# Altium project ProbeControl.PrjPcb
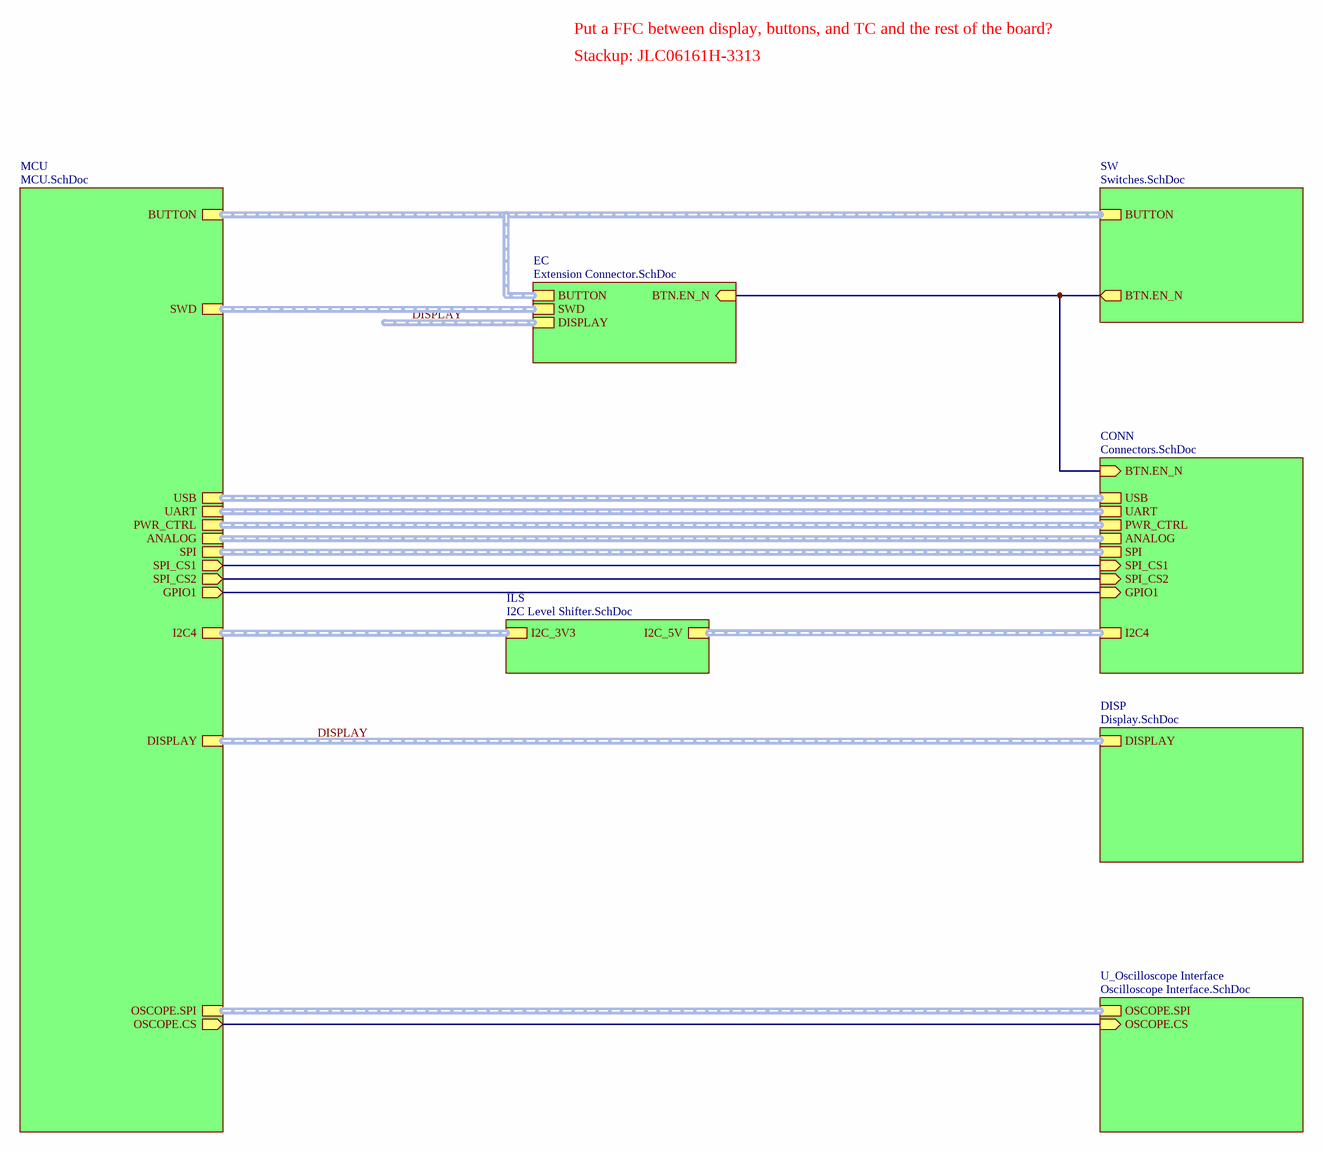
[diagram p0: Top.SchDoc]
8 sheets, 83 parts. Net scope: hierarchical (ports join the sheet entries above them; power ports are global).
Board file: ProbeControl.PcbDoc
Sheets:
  Top.SchDoc
    MCU = MCU.SchDoc
    CONN = Connectors.SchDoc
    DISP = Display.SchDoc
    SW = Switches.SchDoc
    U_Oscilloscope Interface = Oscilloscope Interface.SchDoc
    ILS = I2C Level Shifter.SchDoc
    EC = Extension Connector.SchDoc

## Sheet Top.SchDoc
size 406 x 304 mm; SheetNumber: 1; SheetTotal: 8

### Sub-sheets
CONN = Connectors.SchDoc: USB, UART, PWR_CTRL, ANALOG, SPI, SPI_CS1 (in), SPI_CS2 (in), BTN.EN_N (in), GPIO1 (in), I2C4
DISP = Display.SchDoc: DISPLAY
EC = Extension Connector.SchDoc: BUTTON (harness BTN), BTN.EN_N (in), SWD (harness SWD), DISPLAY
ILS = I2C Level Shifter.SchDoc: I2C_3V3, I2C_5V
MCU = MCU.SchDoc: USB (harness USB), UART (harness UART), PWR_CTRL (harness PWR_CTRL), ANALOG (harness ANALOG), BUTTON (harness BTN), SPI (harness SPI), SPI_CS1 (out), SPI_CS2 (out), DISPLAY (harness I2C), GPIO1 (out), OSCOPE.SPI (harness SPI), OSCOPE.CS (out), I2C4 (harness I2C), SWD (harness SWD)
SW = Switches.SchDoc: BUTTON (harness BTN), BTN.EN_N (out)
U_Oscilloscope Interface = Oscilloscope Interface.SchDoc: OSCOPE.CS (in), OSCOPE.SPI

### Nets
BTN.Enable: sheet CONN/BTN.EN_N, sheet SW/BTN.EN_N, sheet EC/BTN.EN_N
GPIO1: sheet MCU/GPIO1, sheet CONN/GPIO1
SPI1_CS1: sheet MCU/SPI_CS1, sheet CONN/SPI_CS1
SPI1_CS2: sheet MCU/SPI_CS2, sheet CONN/SPI_CS2
SPI2_CS: sheet MCU/OSCOPE.CS, sheet U_Oscilloscope Interface/OSCOPE.CS

### Buses and harness runs
harness DISPLAY = sheet DISP/DISPLAY = sheet MCU/DISPLAY
harness DISPLAY = sheet EC/DISPLAY
harness sheet CONN/ANALOG = sheet MCU/ANALOG
harness sheet CONN/I2C4 = sheet ILS/I2C_5V
harness sheet CONN/PWR_CTRL = sheet MCU/PWR_CTRL
harness sheet CONN/SPI = sheet MCU/SPI
harness sheet CONN/UART = sheet MCU/UART
harness sheet CONN/USB = sheet MCU/USB
harness sheet EC/BUTTON = sheet MCU/BUTTON = sheet SW/BUTTON
harness sheet EC/SWD = sheet MCU/SWD
harness sheet ILS/I2C_3V3 = sheet MCU/I2C4
harness sheet MCU/OSCOPE.SPI = sheet U_Oscilloscope Interface/OSCOPE.SPI

### Notes on the sheet
- Put a FFC between display, buttons, and TC and the rest of the board?
- Stackup: JLC06161H-3313
- Sheet Name:
- Date:
- Sheet
- Designer:
- of

## Sheet MCU.SchDoc
size 406 x 304 mm; SheetNumber: 2; SheetTotal: 8
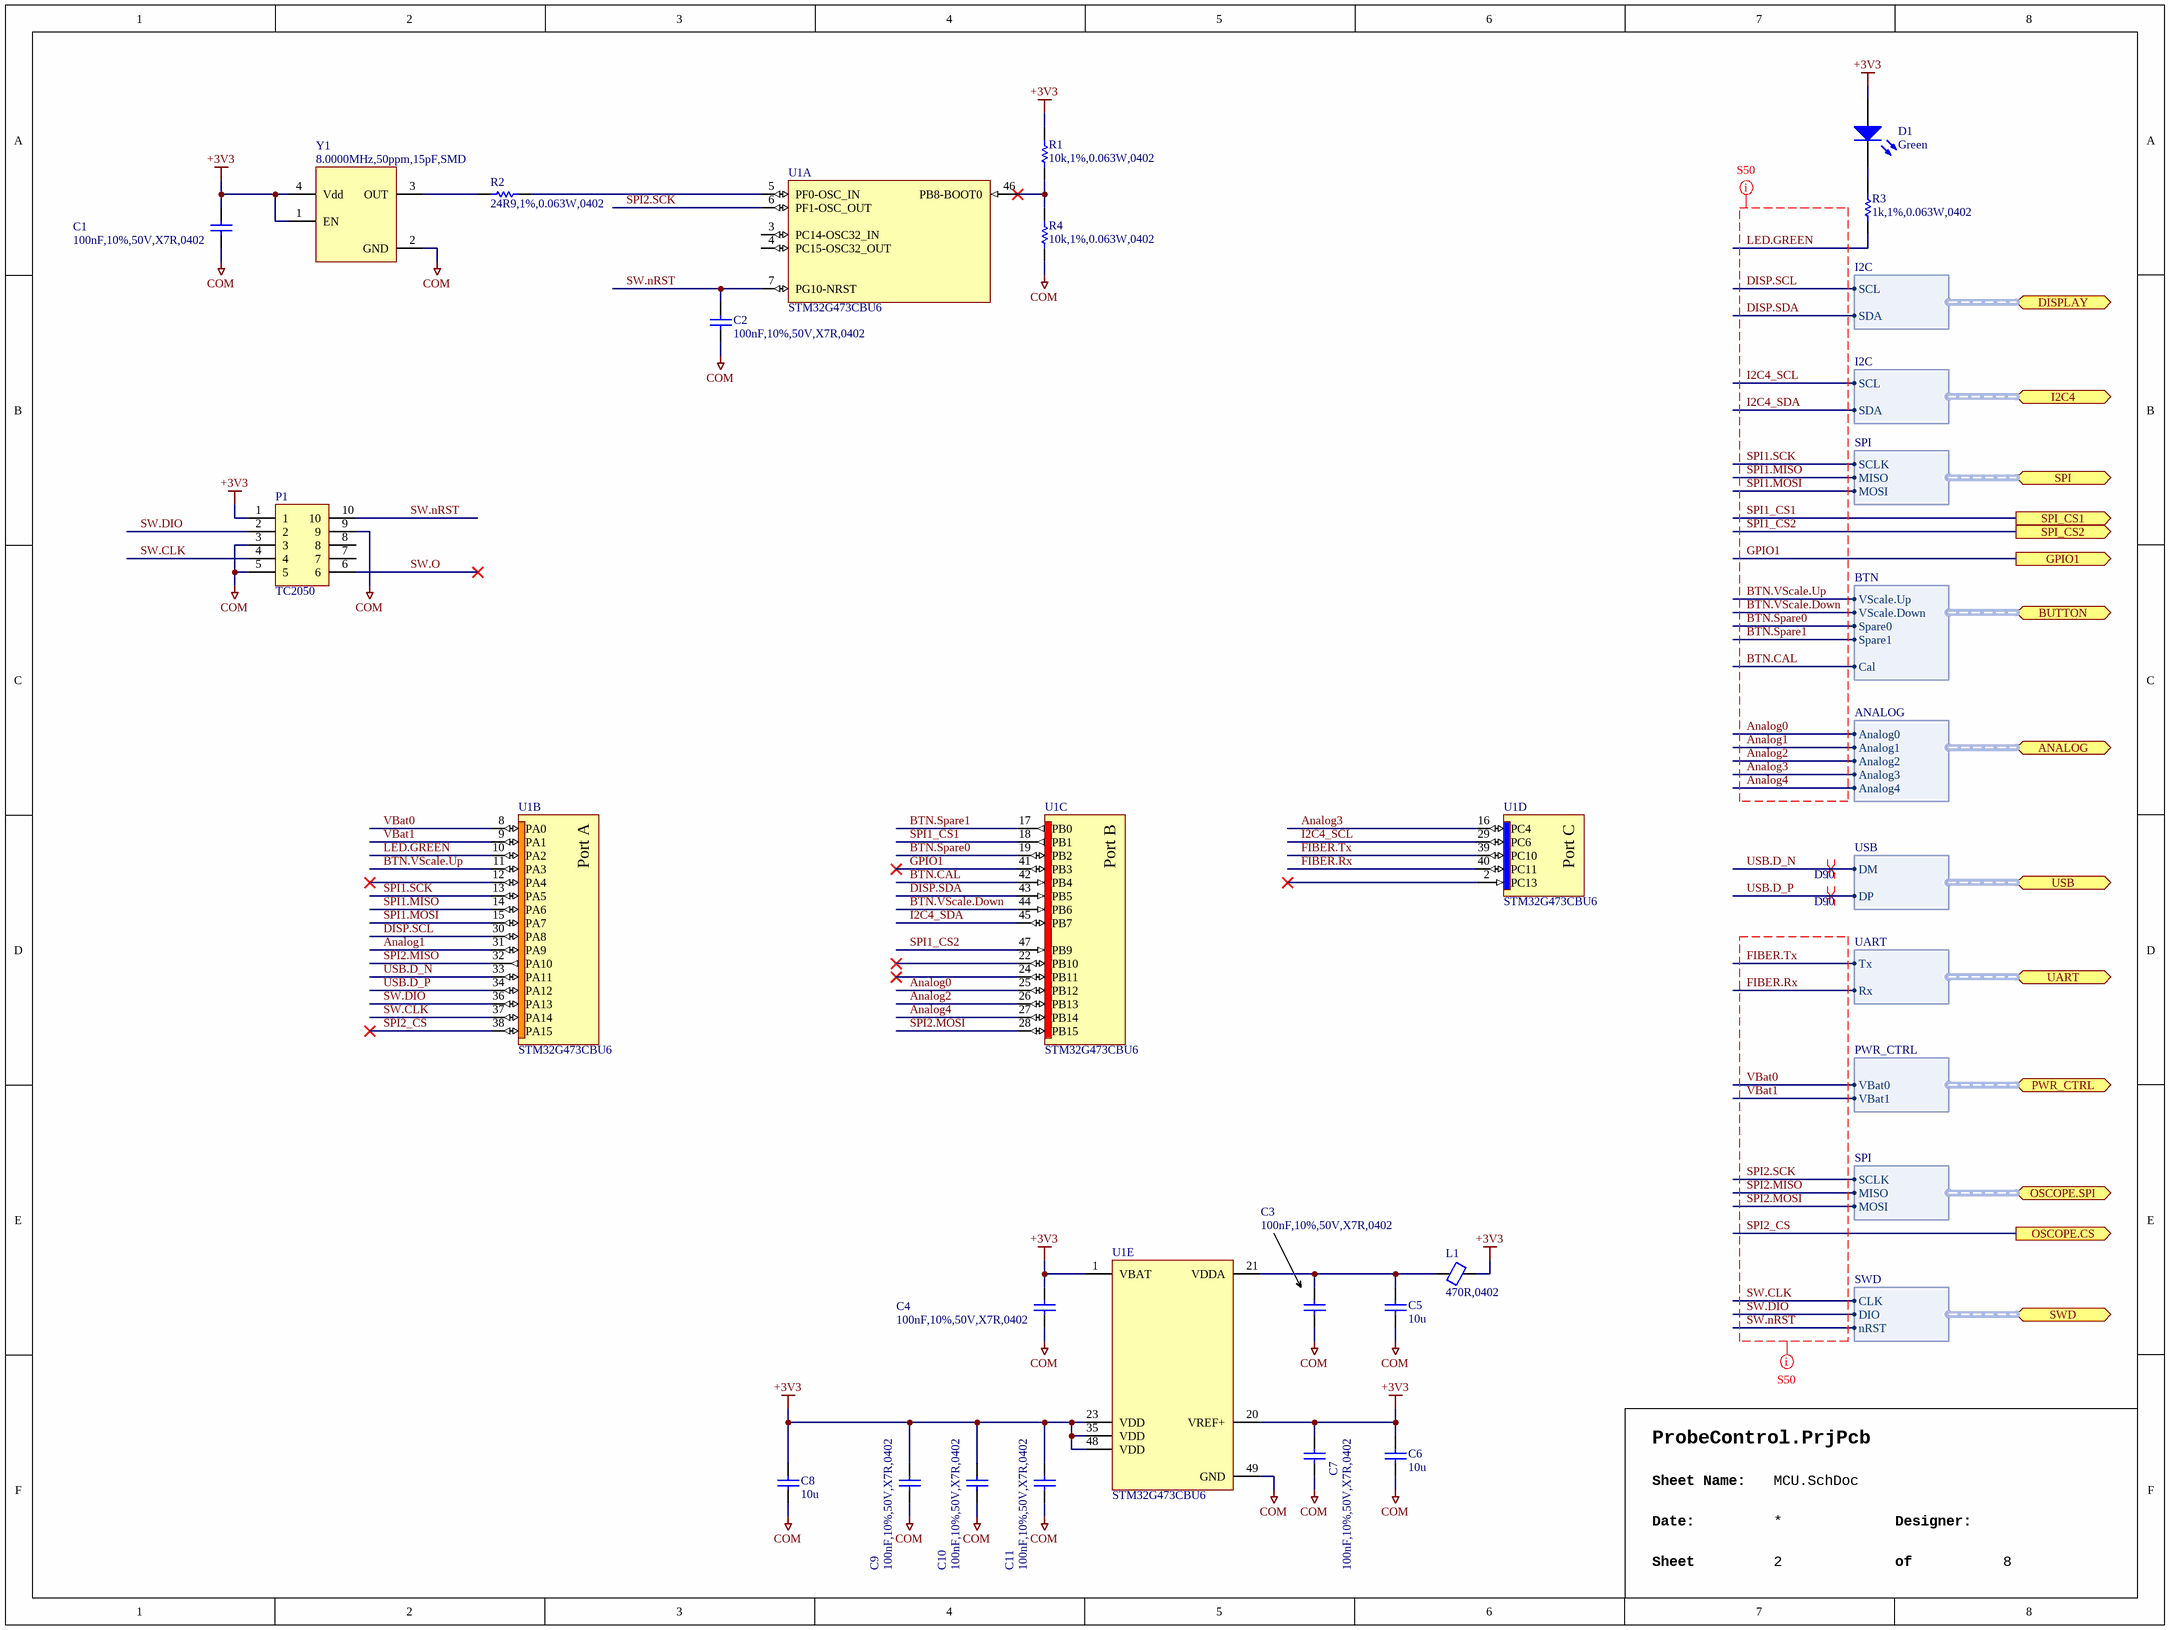
[diagram p1: MCU.SchDoc]

### Parts
C1  100nF,10%,50V,X7R,0402  [CAPC1005X06N]
C2  100nF,10%,50V,X7R,0402  [CAPC1005X06N]
C3  100nF,10%,50V,X7R,0402  [CAPC1005X06N]
C4  100nF,10%,50V,X7R,0402  [CAPC1005X06N]
C5  10u  [CAPC1005X06N]
C6  10u  [CAPC1005X06N]
C7  100nF,10%,50V,X7R,0402  [CAPC1005X06N]
C8  10u  [CAPC1005X06N]
C9  100nF,10%,50V,X7R,0402  [CAPC1005X06N]
C10  100nF,10%,50V,X7R,0402  [CAPC1005X06N]
C11  100nF,10%,50V,X7R,0402  [CAPC1005X06N]
D1  Green  [LITE-ON_LTST-C190KGKT]
L1  470R,0402  [INDC1005X05N]
P1  TC2050  [TAGCONNECT_TC2050-FP]  (no BOM)
R1  10k,1%,0.063W,0402  [RESC1005X04N]
R2  24R9,1%,0.063W,0402  [RESC1005X04N]
R3  1k,1%,0.063W,0402  [RESC1005X04N]
R4  10k,1%,0.063W,0402  [RESC1005X04N]
U1  STM32G473CBU6  [ST_PKG_UFQFN48_A0B9]  (parts A,B,C,D,E of 5)
Y1  8.0000MHz,50ppm,15pF,SMD  [ECS_PKG_3225MV]

### Ports
ANALOG (bidir, harness ANALOG), BUTTON (bidir, harness BTN), DISPLAY (bidir, harness I2C), GPIO1 (out), I2C4 (bidir, harness I2C), OSCOPE.CS (out), OSCOPE.SPI (bidir, harness SPI), PWR_CTRL (bidir, harness PWR_CTRL), SPI (bidir, harness SPI), SPI_CS1 (out), SPI_CS2 (out), SWD (bidir, harness SWD), UART (bidir, harness UART), USB (bidir, harness USB)

### Harnesses
I2C: SCL, SDA
SPI: SCLK, MISO, MOSI
ANALOG: Analog0, Analog1, Analog2, Analog3, Analog4
USB: DM, DP
UART: Tx, Rx
PWR_CTRL: VBat0, VBat1
BTN: VScale.Up, VScale.Down, Spare1, Cal, Spare0
SWD: CLK, DIO, nRST

### Nets
+3V3: C1.1 C4.1 C6.2 C7.1 C8.2 C9.1 C10.1 C11.1 D1.A L1.2 P1.1 R1.2 U1.1(VBAT) U1.20(VREF+) U1.23(VDD) U1.35(VDD) U1.48(VDD) Y1.1(EN) Y1.4(Vdd)
COM: C1.2 C2.1 C3.2 C4.2 C5.1 C6.1 C7.2 C8.1 C9.2 C10.2 C11.2 P1.3 P1.5 P1.9 R4.1 U1.49(GND) Y1.2(GND)
Analog0: U1.25(PB12) ; port ANALOG.Analog0
Analog1: U1.31(PA9) ; port ANALOG.Analog1
Analog2: U1.26(PB13) ; port ANALOG.Analog2
Analog3: U1.16(PC4) ; port ANALOG.Analog3
Analog4: U1.27(PB14) ; port ANALOG.Analog4
BTN.CAL: U1.42(PB4) ; port BUTTON.Cal
BTN.Spare0: U1.19(PB2) ; port BUTTON.Spare0
BTN.Spare1: U1.17(PB0) ; port BUTTON.Spare1
BTN.VScale.Down: U1.44(PB6) ; port BUTTON.VScale.Down
BTN.VScale.Up: U1.11(PA3) ; port BUTTON.VScale.Up
DISP.SCL: U1.30(PA8) ; port DISPLAY.SCL
DISP.SDA: U1.43(PB5) ; port DISPLAY.SDA
FIBER.Rx: U1.40(PC11) ; port UART.Rx
FIBER.Tx: U1.39(PC10) ; port UART.Tx
GPIO1: U1.41(PB3) ; port GPIO1
I2C4_SCL: U1.29(PC6) ; port I2C4.SCL  [project net I2C.SCL.3V3]
I2C4_SDA: U1.45(PB7) ; port I2C4.SDA  [project net I2C.SDA.3V3]
LED.GREEN: R3.1 U1.10(PA2)
SPI1.MISO: U1.14(PA6) ; port SPI.MISO
SPI1.MOSI: U1.15(PA7) ; port SPI.MOSI
SPI1.SCK: U1.13(PA5) ; port SPI.SCLK
SPI1_CS1: U1.18(PB1) ; port SPI_CS1
SPI1_CS2: U1.47(PB9) ; port SPI_CS2
SPI2.MISO: U1.32(PA10) ; port OSCOPE.SPI.MISO
SPI2.MOSI: U1.28(PB15) ; port OSCOPE.SPI.MOSI
SPI2.SCK: U1.6(PF1-OSC_OUT) ; port OSCOPE.SPI.SCLK
SPI2_CS: U1.38(PA15) ; port OSCOPE.CS
SW.CLK: P1.4 U1.37(PA14) ; port SWD.CLK
SW.DIO: P1.2 U1.36(PA13) ; port SWD.DIO
SW.nRST: C2.2 P1.10 U1.7(PG10-NRST) ; port SWD.nRST
SW.O: P1.6
USB.D_N: U1.33(PA11) ; port USB.DM
USB.D_P: U1.34(PA12) ; port USB.DP
VBat0: U1.8(PA0) ; port PWR_CTRL.VBat0
VBat1: U1.9(PA1) ; port PWR_CTRL.VBat1
NetC3_1: C3.1 C5.2 L1.1 U1.21(VDDA)
NetD1_C: D1.C R3.2
NetR1_1: R1.1 R4.2 U1.46(PB8-BOOT0)
NetR2_1: R2.1 Y1.3(OUT)
NetR2_2: R2.2 U1.5(PF0-OSC_IN)

Not connected (* = marked no-connect by the designer): P1 7 8; U1 2(PC13)* 3(PC14-OSC32_IN) 4(PC15-OSC32_OUT) 12(PA4)* 22(PB10)* 24(PB11)*

### Layout directives
net class S50: Analog0, Analog1, Analog2, Analog3, Analog4, BTN.CAL, BTN.Spare0, BTN.Spare1, BTN.VScale.Down, BTN.VScale.Up, DISP.SCL, DISP.SDA, FIBER.Rx, FIBER.Tx, GPIO1, I2C4_SCL, I2C4_SDA, LED.GREEN, SPI1.MISO, SPI1.MOSI, SPI1.SCK, SPI1_CS1, SPI1_CS2, SPI2.MISO, SPI2.MOSI, SPI2.SCK, SPI2_CS, SW.CLK, SW.DIO, SW.nRST, VBat0, VBat1
differential pair; differential pair class D90: USB.D_N, USB.D_P

### Notes on the sheet
- Sheet Name:
- Date:
- Sheet
- Designer:
- of
- (in symbol IC,MCU,QFN48,STM32G473CBU6, part B) Port A
- (in symbol IC,MCU,QFN48,STM32G473CBU6, part C) Port B
- (in symbol IC,MCU,QFN48,STM32G473CBU6, part D) Port C

### Library data of the parts
C1-C4 C7 C9-C11 = CAP,Cer,100nF,10%,50V,X7R,0402: 50V 100nF X7R Â±10% 0402 Ceramic Capacitors ROHS; Manufacturer 1: Murata; Manufacturer 1 Part Number: GRM155R71H104KE14D; Vendor 1 Part Number: C77020; Vendor 1: LCSC; Value: 100n; Part Name: CAP,Cer,100nF,10%,50V,X7R,0402; CreatedBy: Judd Foster; HelpURL: https://www.lcsc.com/datasheet/C77020.pdf
C5 C6 C8 = CAP,Cer,10uF,10VDC,X5R,0402: 10 ï¿½F ï¿½20% 10V Ceramic Capacitor X5R 0402 (1005 Metric); Manufacturer 1: Samsung Electro-Mechanics; Manufacturer 1 Part Number: CL05A106MP5NUNC; Vendor 1 Part Number: 1276-1450-1-ND; Vendor 1: Digikey; Part Name: CAP,Cer,10uF,10VDC,X5R,0402; CreatedBy: Judd Foster; HelpURL: https://media.digikey.com/pdf/Data%20Sheets/Samsung%20PDFs/CL05A106MP5NUNC_Spec.pdf; Value: 10u
D1 = LED,Green,SMD,0603: Green 571nm LED Indication - Discrete 2V 0603 (1608 Metric); Manufacturer 1: Lite-On Inc.; Manufacturer 1 Part Number: LTST-C190KGKT; Vendor 1 Part Number: 160-1435-1-ND; Vendor 1: Digikey; Part Name: LED,Green,SMD,0603; CreatedBy: Judd Foster; HelpURL: https://optoelectronics.liteon.com/upload/download/DS22-2000-074/LTST-C190KGKT.PDF; Value: Green
L1 = Ferrite,470R@100MHz,0402: 470 Ohms @ 100 MHz 1 Power Line Ferrite Bead 0402 (1005 Metric) 1A 200mOhm; Manufacturer 1: Murata Electronics; Manufacturer 1 Part Number: BLM15PX471SN1D; Vendor 1 Part Number: 490-10662-1-ND; Vendor 1: Digikey; Value: 470; Part Name: Ferrite,470R@100MHz,0402; CreatedBy: Judd Foster; HelpURL: https://www.murata.com/en-us/products/productdata/8796740059166/ENFA0018.pdf
P1 = CONN,Tag-Connect,TC2050-IDC: PLUG-OF-NAILS 10-PIN W/ LEGS 8"; Manufacturer 1: Tag-Connect LLC; Part Name: CONN,Tag-Connect,TC2050-IDC; CreatedBy: Kevin Heyer; HelpURL: https://www.tag-connect.com/wp-content/uploads/bsk-pdf-manager/TC2050-IDC_Datasheet_7.pdf; Manufacturer 1 Part Number: N/A
R1 R4 = RES,10k,1%,0.063W,0402: RES 10K OHM 1% 1/16W 0402; Manufacturer 1: Vishay Dale; Manufacturer 1 Part Number: CRCW040210K0FKED; Part Name: RES,10k,1%,0.063W,0402; CreatedBy: Kevin Heyer; HelpURL: https://www.vishay.com/docs/20035/dcrcwe3.pdf; Value: 10k
R2 = RES,24R9,1%,0.063W,0402: RES 24.9 OHM 1% 1/16W 0402; Manufacturer 1: Vishay Dale; Manufacturer 1 Part Number: CRCW040224R9FKED; Value: 24.9; Part Name: RES,24R9,1%,0.063W,0402; CreatedBy: Kevin Heyer; HelpURL: https://www.vishay.com/docs/20035/dcrcwe3.pdf
R3 = RES,1k,1%,0.063W,0402: RES 1K OHM 1% 1/16W 0402; Manufacturer 1: Vishay Dale; Manufacturer 1 Part Number: CRCW04021K00FKED; Part Name: RES,1k,1%,0.063W,0402; CreatedBy: Kevin Heyer; HelpURL: https://www.vishay.com/docs/20035/dcrcwe3.pdf; Value: 1k
U1 = IC,MCU,QFN48,STM32G473CBU6: IC MCU 32BIT 128KB FLSH 48UFQFPN; Manufacturer 1: ST Microelectronics; Part Name: IC,MCU,QFN48,STM32G473CBU6; CreatedBy: Kevin Heyer; HelpURL: https://www.st.com/resource/en/datasheet/stm32g473cb.pdf; Manufacturer 1 Part Number: STM32G473CBU6; Value: STM32G473CBU6
Y1 = XTAL,8.0000MHz,OSC,50ppm,15pF,SMD: Manufacturer 1: ECS Inc.; Manufacturer 1 Part Number: ECS-3225MV-080-BN-TR3; Part Name: XTAL,8.0000MHz,OSC,50ppm,15pF,SMD; CreatedBy: Kevin Heyer; HelpURL: https://ecsxtal.com/store/pdf/ECS-3225MV.pdf; Value: 8.0000MHz,50ppm,15pF,SMD

## Sheet Connectors.SchDoc
size 406 x 304 mm; SheetNumber: 4; SheetTotal: 8
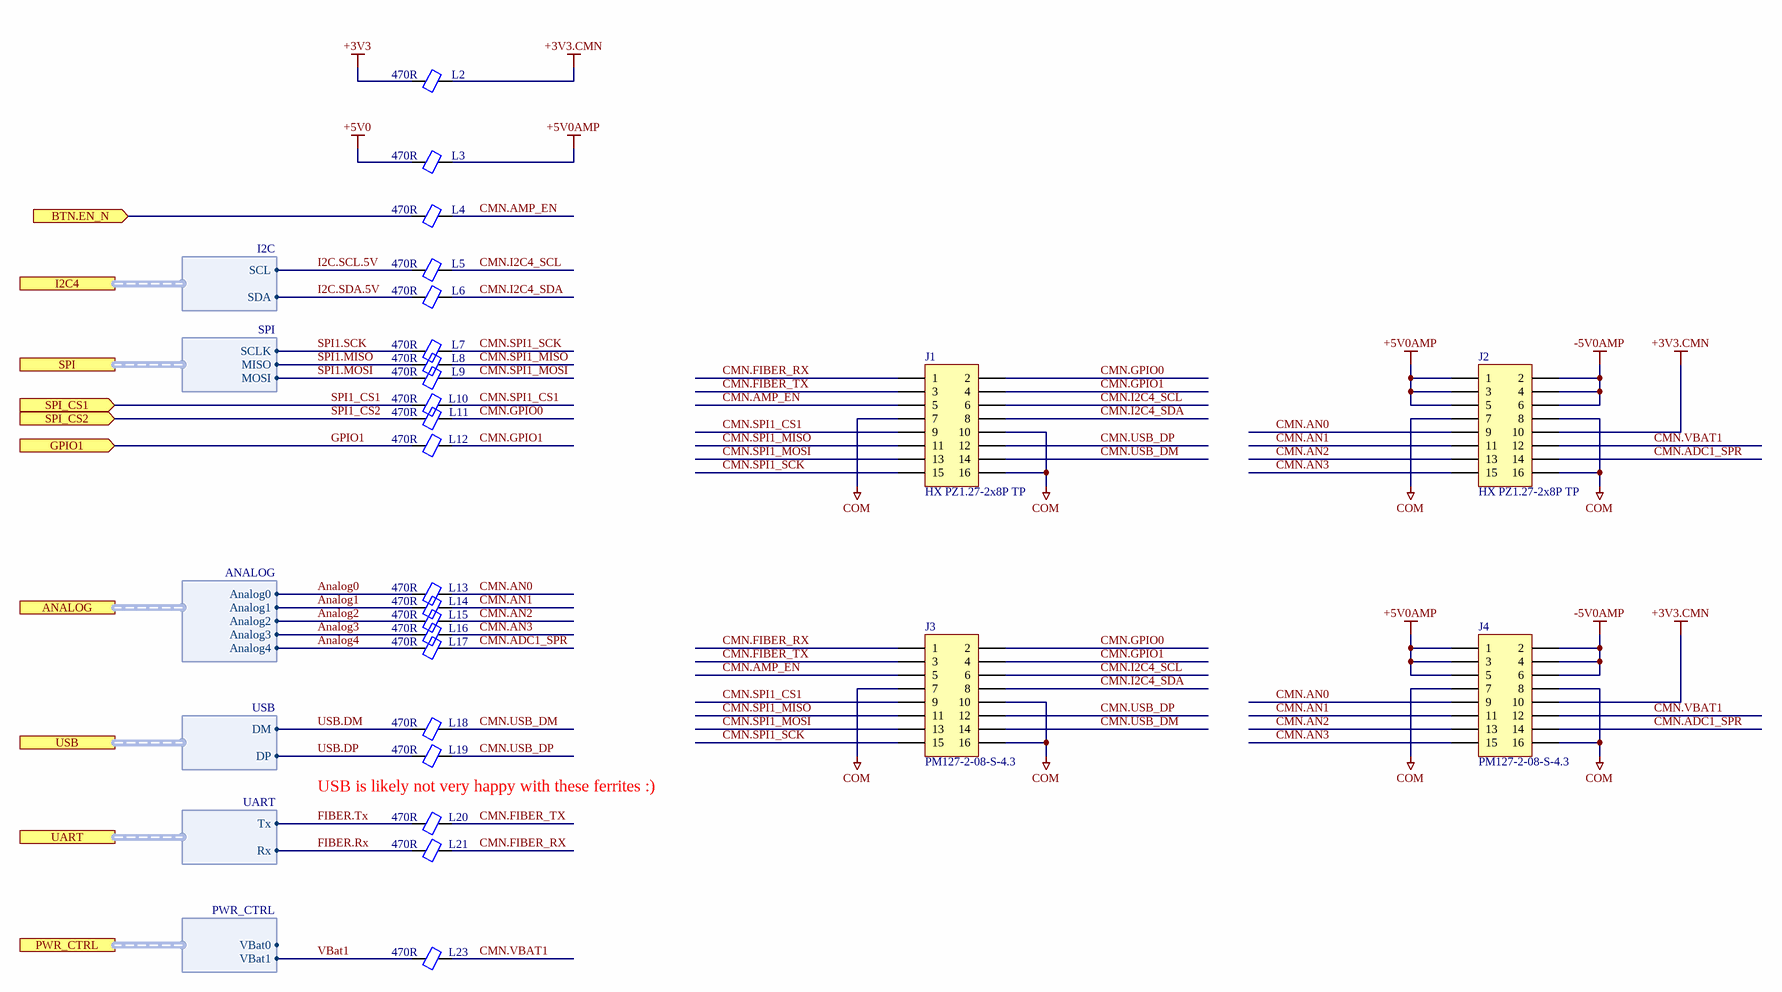
[diagram p2: Connectors.SchDoc]

### Parts
J1  HX PZ1.27-2x8P TP  [HANXIA_HX PZ1.27-2x8P TP]
J2  HX PZ1.27-2x8P TP  [HANXIA_HX PZ1.27-2x8P TP]
J3  PM127-2-08-S-4.3  [HCTL_PM127-2-08-S-4.3]
J4  PM127-2-08-S-4.3  [HCTL_PM127-2-08-S-4.3]
L2  470R  [INDC1005X05N]
L3  470R  [INDC1005X05N]
L4  470R  [INDC1005X05N]
L5  470R  [INDC1005X05N]
L6  470R  [INDC1005X05N]
L7  470R  [INDC1005X05N]
L8  470R  [INDC1005X05N]
L9  470R  [INDC1005X05N]
L10  470R  [INDC1005X05N]
L11  470R  [INDC1005X05N]
L12  470R  [INDC1005X05N]
L13  470R  [INDC1005X05N]
L14  470R  [INDC1005X05N]
L15  470R  [INDC1005X05N]
L16  470R  [INDC1005X05N]
L17  470R  [INDC1005X05N]
L18  470R  [INDC1005X05N]
L19  470R  [INDC1005X05N]
L20  470R  [INDC1005X05N]
L21  470R  [INDC1005X05N]
L23  470R  [INDC1005X05N]

### Ports
ANALOG (harness ANALOG), BTN.EN_N (in), GPIO1 (in), I2C4 (harness I2C), PWR_CTRL (harness PWR_CTRL), SPI (harness SPI), SPI_CS1 (in), SPI_CS2 (in), UART (harness UART), USB (harness USB)

### Harnesses
I2C: SCL, SDA
SPI: SCLK, MISO, MOSI
ANALOG: Analog0, Analog1, Analog2, Analog3, Analog4
USB: DM, DP
UART: Tx, Rx
PWR_CTRL: VBat0, VBat1

### Nets
+3V3: L2.1
+3V3.CMN: J2.10 J4.10 L2.2
+5V0: L3.1
+5V0AMP: J2.1 J2.3 J2.5 J4.1 J4.3 J4.5 L3.2
-5V0AMP: J2.2 J2.4 J2.6 J4.2 J4.4 J4.6
COM: J1.7 J1.10 J1.16 J2.7 J2.8 J2.16 J3.7 J3.10 J3.16 J4.7 J4.8 J4.16
Analog0: L13.1 ; port ANALOG.Analog0
Analog1: L14.1 ; port ANALOG.Analog1
Analog2: L15.1 ; port ANALOG.Analog2
Analog3: L16.1 ; port ANALOG.Analog3
Analog4: L17.1 ; port ANALOG.Analog4
BTN.Enable: L4.1 ; port BTN.EN_N
CMN.ADC1_SPR: J2.14 J4.14 L17.2
CMN.AMP_EN: J1.5 J3.5 L4.2
CMN.AN0: J2.9 J4.9 L13.2
CMN.AN1: J2.11 J4.11 L14.2
CMN.AN2: J2.13 J4.13 L15.2
CMN.AN3: J2.15 J4.15 L16.2
CMN.FIBER_RX: J1.1 J3.1 L21.2
CMN.FIBER_TX: J1.3 J3.3 L20.2
CMN.GPIO0: J1.2 J3.2 L11.2
CMN.GPIO1: J1.4 J3.4 L12.2
CMN.I2C4_SCL: J1.6 J3.6 L5.2
CMN.I2C4_SDA: J1.8 J3.8 L6.2
CMN.SPI1_CS1: J1.9 J3.9 L10.2
CMN.SPI1_MISO: J1.11 J3.11 L8.2
CMN.SPI1_MOSI: J1.13 J3.13 L9.2
CMN.SPI1_SCK: J1.15 J3.15 L7.2
CMN.USB_DM: J1.14 J3.14 L18.2
CMN.USB_DP: J1.12 J3.12 L19.2
CMN.VBAT1: J2.12 J4.12 L23.2
FIBER.Rx: L21.1 ; port UART.Rx
FIBER.Tx: L20.1 ; port UART.Tx
GPIO1: L12.1 ; port GPIO1
I2C.SCL.5V: L5.1 ; port I2C4.SCL
I2C.SDA.5V: L6.1 ; port I2C4.SDA
SPI1.MISO: L8.1 ; port SPI.MISO
SPI1.MOSI: L9.1 ; port SPI.MOSI
SPI1.SCK: L7.1 ; port SPI.SCLK
SPI1_CS1: L10.1 ; port SPI_CS1
SPI1_CS2: L11.1 ; port SPI_CS2
USB.DM: L18.1 ; port USB.DM  [project net USB.D_N]
USB.DP: L19.1 ; port USB.DP  [project net USB.D_P]
VBat1: L23.1 ; port PWR_CTRL.VBat1

### Notes on the sheet
- USB is likely not very happy with these ferrites :)
- Sheet Name:
- Date:
- Sheet
- Designer:
- of

### Library data of the parts
J1 J2 = CONN,Hdr,2x8 Pin,1.27mm,SMD: CONN HEADER 16POS 1.27mm DUAL ROW SMD; Manufacturer 1: hanxia; Vendor 1 Part Number: C41376040; Vendor 1: LCSC; Part Name: CONN,Hdr,2x8 Pin,1.27mm,SMD; CreatedBy: Judd Foster; HelpURL: https://www.lcsc.com/datasheet/C41376040.pdf?spm=wm.sxq.inf.ggs___wm.fly.bg.0.xh&lcsc_vid=T1ELXwUHQlNYVlZRE1JdXlRQFVgNBF1eTlFXBVxWRAAxVlNeQ1lYVlFUQlNXXjsOAxUeFF5JWBYZEEoKFBINSQcJGk4eFQsCAgIaSgADAwAHC0slRFhZUlVVQ08GEwkK; Manufacturer 1 Part Number: HX PZ1.27-2x8P TP
J3 J4 = CONN,Rcpt,2x8 Pin,1.27mm,SMD: CONN SOCKET 16POS 1.27mm DUAL ROW SMD; Manufacturer 1: HCTL; Vendor 1 Part Number: C3975134; Vendor 1: LCSC; Part Name: CONN,Rcpt,2x8 Pin,1.27mm,SMD; CreatedBy: Judd Foster; HelpURL: https://www.lcsc.com/datasheet/C3975134.pdf?spm=wm.sxq.inf.ggs___wm.fly.bg.0.xh&lcsc_vid=T1ELXwUHQlNYVlZRE1JdXlRQFVgNBF1eTlFXBVxWRAAxVlNeQ1lYVldfR1VbXjsOAxUeFF5JWBYZEEoKFBINSQcJGk4dAgUUFAk%3D; Manufacturer 1 Part Number: PM127-2-08-S-4.3
L2-L21 L23 = Ferrite,470R@100MHz,0402: 470 Ohms @ 100 MHz 1 Power Line Ferrite Bead 0402 (1005 Metric) 1A 200mOhm; Manufacturer 1: Murata Electronics; Manufacturer 1 Part Number: BLM15PX471SN1D; Vendor 1 Part Number: 490-10662-1-ND; Vendor 1: Digikey; Part Name: Ferrite,470R@100MHz,0402; CreatedBy: Judd Foster; HelpURL: https://www.murata.com/en-us/products/productdata/8796740059166/ENFA0018.pdf; Value: 470R

## Sheet Display.SchDoc
size 406 x 304 mm; SheetNumber: 5; SheetTotal: 8
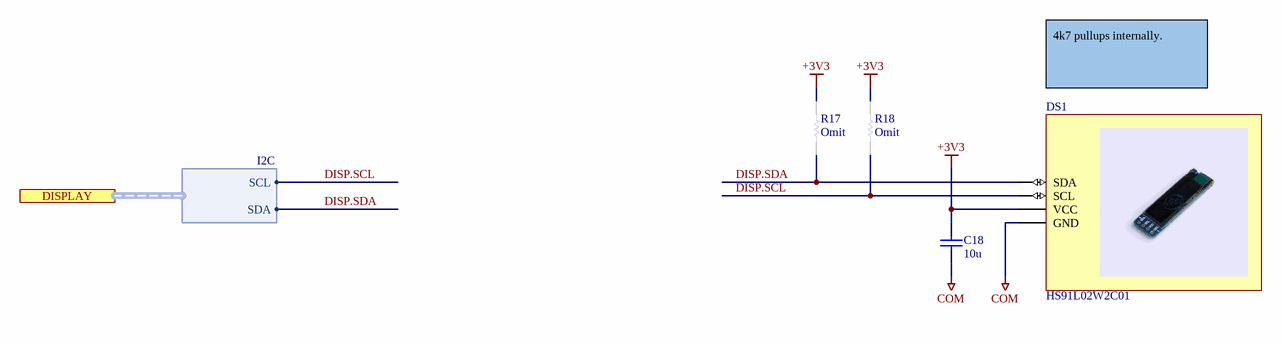
[diagram p3: Display.SchDoc]

### Parts
C18  10u  [CAPC1005X06N]
DS1  HS91L02W2C01  [HS_HS91L02W2C01]
R17  Omit  [RESC1005X04N]  (no BOM)
R18  Omit  [RESC1005X04N]  (no BOM)

### Ports
DISPLAY (harness I2C)

### Harnesses
I2C: SCL, SDA

### Nets
+3V3: C18.2 DS1.2(VCC) R17.2 R18.2
COM: C18.1 DS1.1(GND)
DISP.SCL: DS1.3(SCL) R18.1 ; port DISPLAY.SCL
DISP.SDA: DS1.4(SDA) R17.1 ; port DISPLAY.SDA

### Notes on the sheet
- 4k7 pullups internally.
- Sheet Name:
- Date:
- Sheet
- Designer:
- of

### Library data of the parts
C18 = CAP,Cer,10uF,10VDC,X5R,0402: as C5 on sheet MCU; Part Name: CAP,Cer,10uF,10VDC,X5R,0402; CreatedBy: Judd Foster; HelpURL: https://media.digikey.com/pdf/Data%20Sheets/Samsung%20PDFs/CL05A106MP5NUNC_Spec.pdf; Value: 10u
DS1 = DISP,Graphic,OLED,128x32,HS91L02W2C01: 0.91 128x32 SSD1306 chip I2C LCD, OLED, Graphic; Manufacturer 1: HS; Vendor 1 Part Number: C5248081; Vendor 1: LCSC; Part Name: DISP,Graphic,OLED,128x32,HS91L02W2C01; CreatedBy: Judd Foster; HelpURL: https://www.lcsc.com/datasheet/C5248081.pdf; Manufacturer 1 Part Number: HS91L02W2C01
R17 R18 = RES,Omit,0402: Part Name: RES,Omit,0402; CreatedBy: Judd Foster; HelpURL: N/A; Manufacturer 1: N/A; Manufacturer 1 Part Number: N/A; Vendor 1: N/A; Vendor 1 Part Number: N/A; Value: Omit

## Sheet Switches.SchDoc
size 406 x 304 mm; SheetNumber: 3; SheetTotal: 8
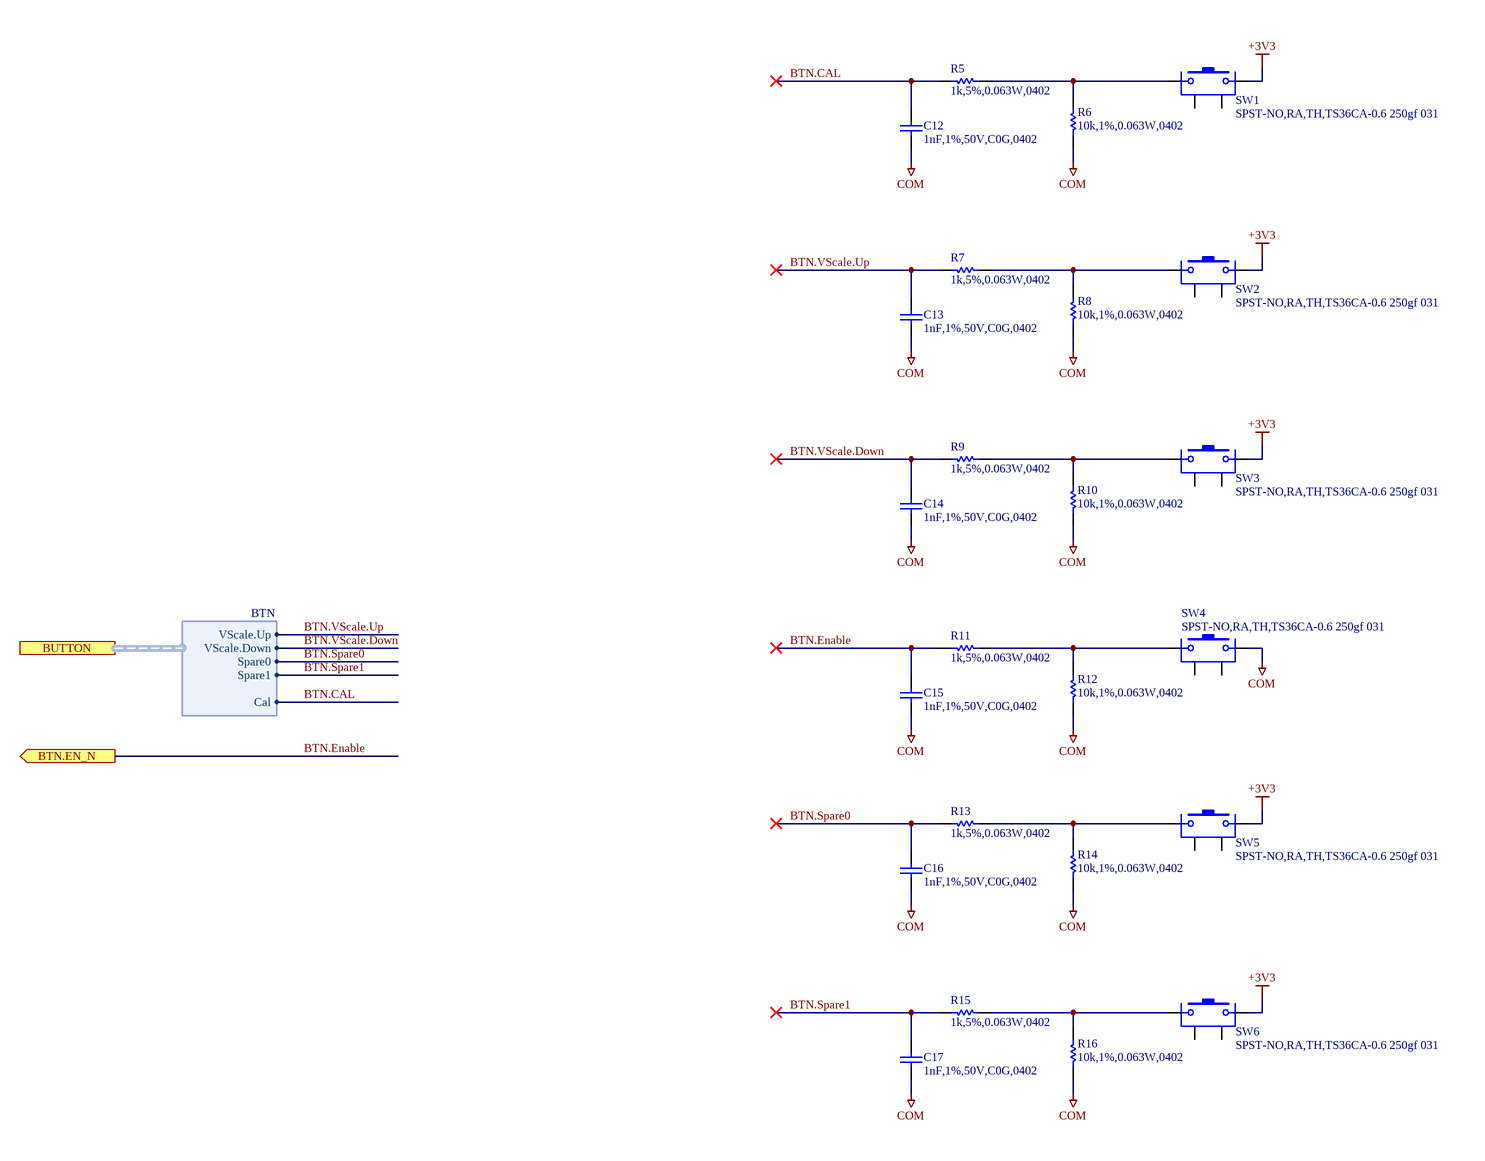
[diagram p4: Switches.SchDoc]

### Parts
C12  1nF,1%,50V,C0G,0402  [CAPC1005X06N]
C13  1nF,1%,50V,C0G,0402  [CAPC1005X06N]
C14  1nF,1%,50V,C0G,0402  [CAPC1005X06N]
C15  1nF,1%,50V,C0G,0402  [CAPC1005X06N]
C16  1nF,1%,50V,C0G,0402  [CAPC1005X06N]
C17  1nF,1%,50V,C0G,0402  [CAPC1005X06N]
R5  1k,5%,0.063W,0402  [RESC1005X04N]
R6  10k,1%,0.063W,0402  [RESC1005X04N]
R7  1k,5%,0.063W,0402  [RESC1005X04N]
R8  10k,1%,0.063W,0402  [RESC1005X04N]
R9  1k,5%,0.063W,0402  [RESC1005X04N]
R10  10k,1%,0.063W,0402  [RESC1005X04N]
R11  1k,5%,0.063W,0402  [RESC1005X04N]
R12  10k,1%,0.063W,0402  [RESC1005X04N]
R13  1k,5%,0.063W,0402  [RESC1005X04N]
R14  10k,1%,0.063W,0402  [RESC1005X04N]
R15  1k,5%,0.063W,0402  [RESC1005X04N]
R16  10k,1%,0.063W,0402  [RESC1005X04N]
SW1  SPST-NO,RA,TH,TS36CA-0.6 250gf 031  [SHOU_HAN_TS36CA-0.6 250gf 031]
SW2  SPST-NO,RA,TH,TS36CA-0.6 250gf 031  [SHOU_HAN_TS36CA-0.6 250gf 031]
SW3  SPST-NO,RA,TH,TS36CA-0.6 250gf 031  [SHOU_HAN_TS36CA-0.6 250gf 031]
SW4  SPST-NO,RA,TH,TS36CA-0.6 250gf 031  [SHOU_HAN_TS36CA-0.6 250gf 031]
SW5  SPST-NO,RA,TH,TS36CA-0.6 250gf 031  [SHOU_HAN_TS36CA-0.6 250gf 031]
SW6  SPST-NO,RA,TH,TS36CA-0.6 250gf 031  [SHOU_HAN_TS36CA-0.6 250gf 031]

### Ports
BTN.EN_N (out), BUTTON (harness BTN)

### Harnesses
BTN: VScale.Up, VScale.Down, Spare1, Cal, Spare0

### Nets
+3V3: SW1.1 SW2.1 SW3.1 SW5.1 SW6.1
COM: C12.1 C13.1 C14.1 C15.1 C16.1 C17.1 R6.1 R8.1 R10.1 R12.1 R14.1 R16.1 SW4.1
BTN.CAL: C12.2 R5.2 ; port BUTTON.Cal
BTN.Enable: C15.2 R11.2 ; port BTN.EN_N
BTN.Spare0: C16.2 R13.2 ; port BUTTON.Spare0
BTN.Spare1: C17.2 R15.2 ; port BUTTON.Spare1
BTN.VScale.Down: C14.2 R9.2 ; port BUTTON.VScale.Down
BTN.VScale.Up: C13.2 R7.2 ; port BUTTON.VScale.Up
NetR5_1: R5.1 R6.2 SW1.2
NetR7_1: R7.1 R8.2 SW2.2
NetR9_1: R9.1 R10.2 SW3.2
NetR11_1: R11.1 R12.2 SW4.2
NetR13_1: R13.1 R14.2 SW5.2
NetR15_1: R15.1 R16.2 SW6.2

Not connected (* = marked no-connect by the designer): SW1 0; SW2 0; SW3 0; SW4 0; SW5 0; SW6 0

### Notes on the sheet
- Sheet Name:
- Date:
- Sheet
- Designer:
- of

### Library data of the parts
C12-C17 = CAP,CER,1nF,1%,50V,C0G,0402: Manufacturer 1: Murata; Manufacturer 1 Part Number: GCM1555C1H102FA16D; Value: 1n; Part Name: CAP,CER,1nF,1%,50V,C0G,0402; CreatedBy: Kevin Heyer; HelpURL: https://pim.murata.com/asset/pim4/ceramicCapacitorSMD/GCM1555C1H102FA16-01A-EN_PDF_CERAMICCAPACITORSMD
R5 R7 R9 R11 R13 R15 = RES,1k,5%,0.063W,0402: 1 kOhms ï¿½5% 0.063W, 1/16W Chip Resistor 0402 (1005 Metric) Automotive AEC-Q200 Thick Film; Manufacturer 1: Stackpole Electronics Inc; Manufacturer 1 Part Number: RMCF0402JT1K00; Vendor 1 Part Number: RMCF0402JT1K00CT-ND; Vendor 1: DIgikey; Part Name: RES,1k,5%,0.063W,0402; CreatedBy: Judd Foster; HelpURL: https://www.seielect.com/catalog/sei-rmcf_rmcp.pdf; Value: 1k
R6 R8 R10 R12 R14 R16 = RES,10k,1%,0.063W,0402: as R1 on sheet MCU; Part Name: RES,10k,1%,0.063W,0402; CreatedBy: Kevin Heyer; HelpURL: https://www.vishay.com/docs/20035/dcrcwe3.pdf; Value: 10k
SW1-SW6 = Switch,Tactile,SPST-NO,RA,TH,TS36CA-0.6 250gf 031: Manufacturer 1: SHOU HAN; Vendor 1 Part Number: C2906288; Vendor 1: LCSC; Part Name: Switch,Tactile,SPST-NO,RA,TH,TS36CA-0.6 250gf 031; CreatedBy: Kevin Heyer; HelpURL: https://www.lcsc.com/datasheet/C2906288.pdf; Manufacturer 1 Part Number: TS36CA-0.6 250gf 031; Value: TS36CA-0.6 250gf 031

## Sheet Oscilloscope Interface.SchDoc
size 406 x 304 mm; SheetNumber: 8; SheetTotal: 9
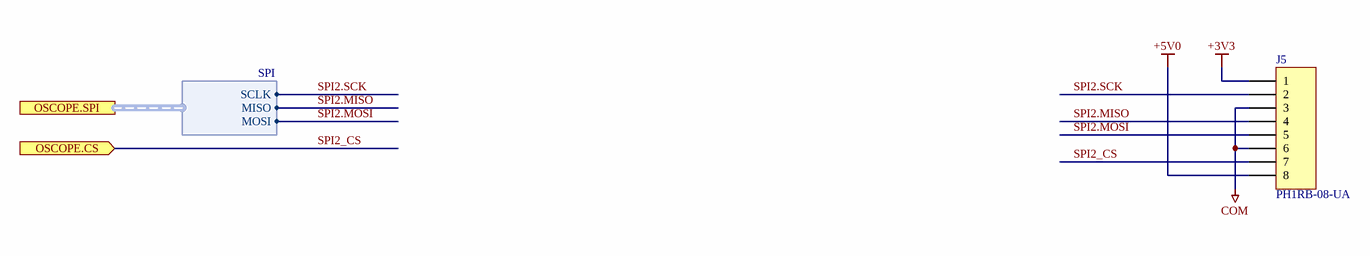
[diagram p5: Oscilloscope Interface.SchDoc]

### Parts
J5  PH1RB-08-UA  [ADAMTECH_PH1RB-08-UA]

### Ports
OSCOPE.CS (in), OSCOPE.SPI (harness SPI)

### Harnesses
SPI: SCLK, MISO, MOSI

### Nets
+3V3: J5.1
+5V0: J5.8
COM: J5.3 J5.6
SPI2.MISO: J5.4 ; port OSCOPE.SPI.MISO
SPI2.MOSI: J5.5 ; port OSCOPE.SPI.MOSI
SPI2.SCK: J5.2 ; port OSCOPE.SPI.SCLK
SPI2_CS: J5.7 ; port OSCOPE.CS

### Notes on the sheet
- Sheet Name:
- Date:
- Sheet
- Designer:
- of

### Library data of the parts
J5 = Term,Header,1x8 Pin,2.54mm,Right,Thru: Connector Header Through Hole, Right Angle 8 position 0.100" (2.54mm); Manufacturer 1: Adam Tech; Vendor 1 Part Number: 2057-PH1RB-08-UA-ND; Vendor 1: Digikey; Part Name: Term,Header,1x8 Pin,2.54mm,Right,Thru; CreatedBy: Judd Foster; HelpURL: https://app.adam-tech.com/products/download/data_sheet/201281/ph1rb-xx-ua-data-sheet.pdf; Manufacturer 1 Part Number: PH1RB-08-UA

## Sheet I2C Level Shifter.SchDoc
size 406 x 304 mm; SheetNumber: 6; SheetTotal: 8
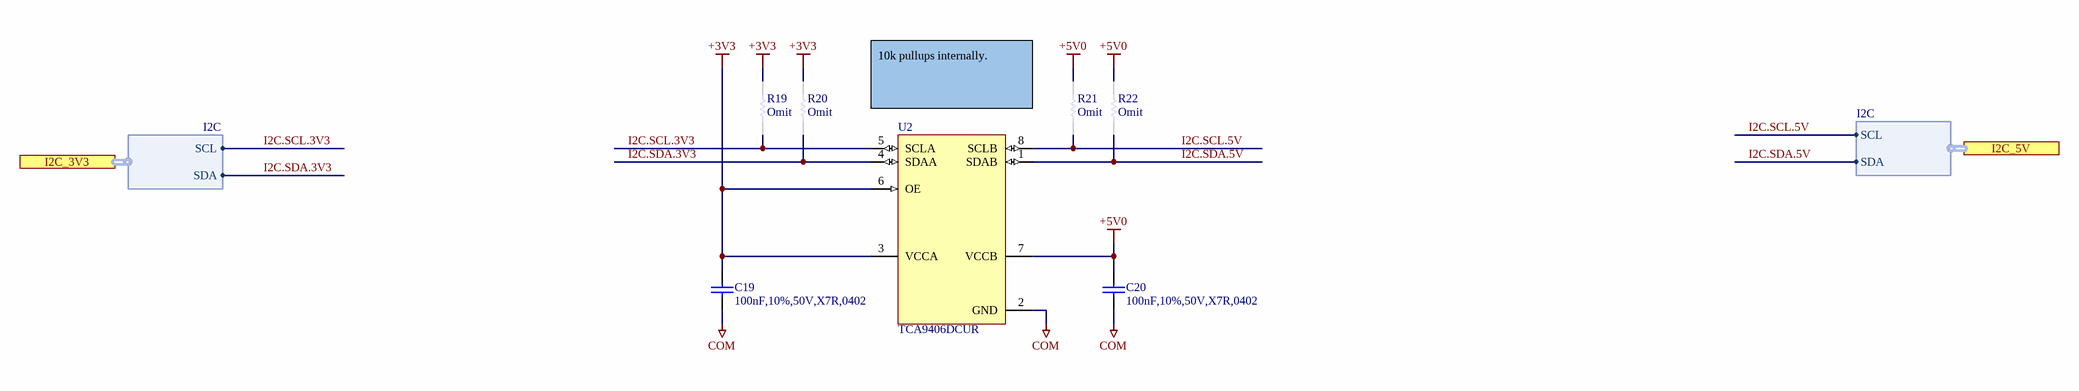
[diagram p6: I2C Level Shifter.SchDoc]

### Parts
C19  100nF,10%,50V,X7R,0402  [CAPC1005X06N]
C20  100nF,10%,50V,X7R,0402  [CAPC1005X06N]
R19  Omit  [RESC1005X04N]  (no BOM)
R20  Omit  [RESC1005X04N]  (no BOM)
R21  Omit  [RESC1005X04N]  (no BOM)
R22  Omit  [RESC1005X04N]  (no BOM)
U2  TCA9406DCUR  [TEXASINSTRUMENTS_PKG_DCU0008A]

### Ports
I2C_3V3 (harness I2C), I2C_5V (harness I2C)

### Harnesses
I2C: SCL, SDA

### Nets
+3V3: C19.2 R19.2 R20.2 U2.3(VCCA) U2.6(OE)
+5V0: C20.2 R21.2 R22.2 U2.7(VCCB)
COM: C19.1 C20.1 U2.2(GND)
I2C.SCL.3V3: R19.1 U2.5(SCLA) ; port I2C_3V3.SCL
I2C.SCL.5V: R21.1 U2.8(SCLB) ; port I2C_5V.SCL
I2C.SDA.3V3: R20.1 U2.4(SDAA) ; port I2C_3V3.SDA
I2C.SDA.5V: R22.1 U2.1(SDAB) ; port I2C_5V.SDA

### Notes on the sheet
- 10k pullups internally.
- Sheet Name:
- Date:
- Sheet
- Designer:
- of

### Library data of the parts
C19 C20 = CAP,Cer,100nF,10%,50V,X7R,0402: as C1 on sheet MCU; Part Name: CAP,Cer,100nF,10%,50V,X7R,0402; CreatedBy: Judd Foster; HelpURL: https://www.lcsc.com/datasheet/C77020.pdf
R19-R22 = RES,Omit,0402: Part Name: RES,Omit,0402; CreatedBy: Judd Foster; HelpURL: N/A; Manufacturer 1: N/A; Manufacturer 1 Part Number: N/A; Vendor 1: N/A; Vendor 1 Part Number: N/A; Value: Omit
U2 = TCA9406DCUR: Voltage Level Translator Bidirectional 1 Circuit 2 Channel 24Mbps 8-VSSOP; Manufacturer 1: Texas Instruments; Vendor 1 Part Number: 296-28109-1-ND; Vendor 1: DigiKey; Part Name: TCA9406DCUR; CreatedBy: Judd Foster; HelpURL: https://www.ti.com/general/docs/suppproductinfo.tsp?distId=10&gotoUrl=https%3A%2F%2Fwww.ti.com%2Flit%2Fgpn%2Ftca9406; Manufacturer 1 Part Number: TCA9406DCUR

## Sheet Extension Connector.SchDoc
size 406 x 304 mm; SheetNumber: 9; SheetTotal: 9
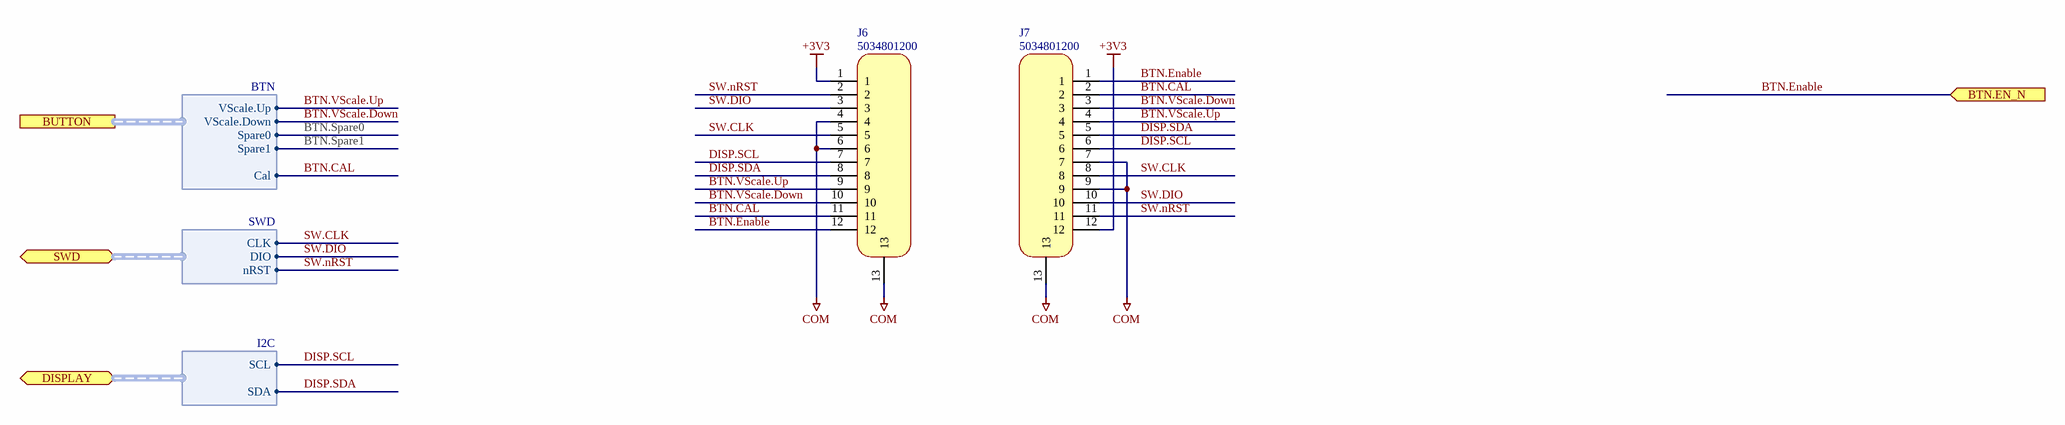
[diagram p7: Extension Connector.SchDoc]

### Parts
J6  5034801200  [MOLEX_5034801200]
J7  5034801200  [MOLEX_5034801200]

### Ports
BTN.EN_N (in), BUTTON (harness BTN), DISPLAY (bidir, harness I2C), SWD (bidir, harness SWD)

### Harnesses
BTN: VScale.Up, VScale.Down, Spare1, Cal, Spare0
SWD: CLK, DIO, nRST
I2C: SCL, SDA

### Nets
+3V3: J6.1 J7.12
COM: J6.4 J6.6 J6.13 J7.7 J7.9 J7.13
BTN.CAL: J6.11 J7.2 ; port BUTTON.Cal
BTN.Enable: J6.12 J7.1 ; port BTN.EN_N
BTN.VScale.Down: J6.10 J7.3 ; port BUTTON.VScale.Down
BTN.VScale.Up: J6.9 J7.4 ; port BUTTON.VScale.Up
DISP.SCL: J6.7 J7.6 ; port DISPLAY.SCL
DISP.SDA: J6.8 J7.5 ; port DISPLAY.SDA
SW.CLK: J6.5 J7.8 ; port SWD.CLK
SW.DIO: J6.3 J7.10 ; port SWD.DIO
SW.nRST: J6.2 J7.11 ; port SWD.nRST

### Notes on the sheet
- Sheet Name:
- Date:
- Sheet
- Designer:
- of

### Library data of the parts
J6 J7 = Conn,FPC,12pin,RA,0.5mm,5034801200: CONN FFC FPC 12POS 0.5mm TOP AND BOTTOM CNT SMD R/A; Manufacturer 1: Molex; Part Name: Conn,FPC,12pin,RA,0.5mm,5034801200; CreatedBy: Kevin Heyer; HelpURL: https://www.molex.com/content/dam/molex/molex-dot-com/products/automated/en-us/salesdrawingpdf/503/503480/5034801200_sd.pdf?inline\; Manufacturer 1 Part Number: 5034801200

## Nets that join several sheets
+3V3: MCU (19 pins), Connectors (L2.1), Display (C18.2 DS1.2 R17.2 R18.2), Switches (5 pins), Oscilloscope Interface (J5.1), I2C Level Shifter (5 pins), Extension Connector (J6.1 J7.12)
+5V0: Connectors (L3.1), Oscilloscope Interface (J5.8), I2C Level Shifter (C20.2 R21.2 R22.2 U2.7)
COM: MCU (17 pins), Connectors (12 pins), Display (C18.1 DS1.1), Switches (13 pins), Oscilloscope Interface (J5.3 J5.6), I2C Level Shifter (C19.1 C20.1 U2.2), Extension Connector (6 pins)
Analog0: MCU (U1.25), Connectors (L13.1)
Analog1: MCU (U1.31), Connectors (L14.1)
Analog2: MCU (U1.26), Connectors (L15.1)
Analog3: MCU (U1.16), Connectors (L16.1)
Analog4: MCU (U1.27), Connectors (L17.1)
BTN.CAL: MCU (U1.42), Switches (C12.2 R5.2), Extension Connector (J6.11 J7.2)
BTN.Enable: Connectors (L4.1), Switches (C15.2 R11.2), Extension Connector (J6.12 J7.1)
BTN.Spare0: MCU (U1.19), Switches (C16.2 R13.2)
BTN.Spare1: MCU (U1.17), Switches (C17.2 R15.2)
BTN.VScale.Down: MCU (U1.44), Switches (C14.2 R9.2), Extension Connector (J6.10 J7.3)
BTN.VScale.Up: MCU (U1.11), Switches (C13.2 R7.2), Extension Connector (J6.9 J7.4)
DISP.SCL: MCU (U1.30), Display (DS1.3 R18.1), Extension Connector (J6.7 J7.6)
DISP.SDA: MCU (U1.43), Display (DS1.4 R17.1), Extension Connector (J6.8 J7.5)
FIBER.Rx: MCU (U1.40), Connectors (L21.1)
FIBER.Tx: MCU (U1.39), Connectors (L20.1)
GPIO1: MCU (U1.41), Connectors (L12.1)
I2C.SCL.3V3: MCU (U1.29), I2C Level Shifter (R19.1 U2.5)
I2C.SCL.5V: Connectors (L5.1), I2C Level Shifter (R21.1 U2.8)
I2C.SDA.3V3: MCU (U1.45), I2C Level Shifter (R20.1 U2.4)
I2C.SDA.5V: Connectors (L6.1), I2C Level Shifter (R22.1 U2.1)
SPI1.MISO: MCU (U1.14), Connectors (L8.1)
SPI1.MOSI: MCU (U1.15), Connectors (L9.1)
SPI1.SCK: MCU (U1.13), Connectors (L7.1)
SPI1_CS1: MCU (U1.18), Connectors (L10.1)
SPI1_CS2: MCU (U1.47), Connectors (L11.1)
SPI2.MISO: MCU (U1.32), Oscilloscope Interface (J5.4)
SPI2.MOSI: MCU (U1.28), Oscilloscope Interface (J5.5)
SPI2.SCK: MCU (U1.6), Oscilloscope Interface (J5.2)
SPI2_CS: MCU (U1.38), Oscilloscope Interface (J5.7)
SW.CLK: MCU (P1.4 U1.37), Extension Connector (J6.5 J7.8)
SW.DIO: MCU (P1.2 U1.36), Extension Connector (J6.3 J7.10)
SW.nRST: MCU (C2.2 P1.10 U1.7), Extension Connector (J6.2 J7.11)
USB.D_N: MCU (U1.33), Connectors (L18.1)
USB.D_P: MCU (U1.34), Connectors (L19.1)
VBat1: MCU (U1.9), Connectors (L23.1)